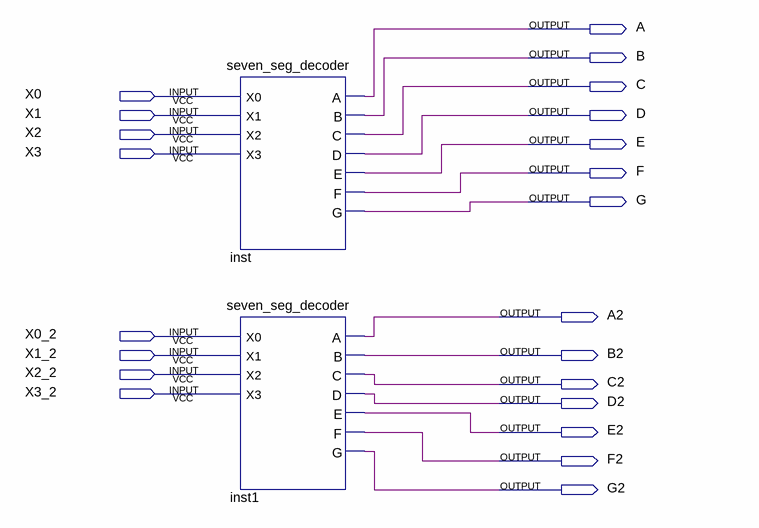
[diagram p0: schematic sheet]
// Quartus schematic lab5_1.bdf as structural Verilog: 2 symbols, 22 pins
module lab5_1 (
  input  X0,
  input  X1,
  input  X2,
  input  X3,
  input  X0_2,
  input  X1_2,
  input  X2_2,
  input  X3_2,
  output A,
  output B,
  output C,
  output D,
  output E,
  output F,
  output G,
  output A2,
  output B2,
  output C2,
  output D2,
  output E2,
  output F2,
  output G2
);

  seven_seg_decoder inst (.X0(X0), .X1(X1), .X2(X2), .X3(X3), .A(A), .B(B), .C(C), .D(D), .E(E), .F(F), .G(G));
  seven_seg_decoder inst1 (
    .X0(X0_2), .X1(X1_2), .X2(X2_2), .X3(X3_2), .A(A2), .B(B2), .C(C2), .D(D2), .E(E2), .F(F2), .G(G2));
endmodule
